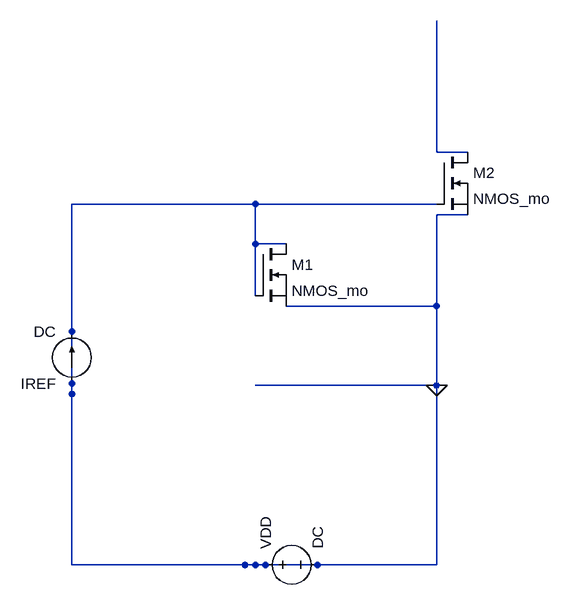
[diagram p0: schematic netlist7.asc]
netlist7.asc, the LTspice schematic file:
Version 4
SHEET 1 680 480
SYMBOL voltage 540 1095 R270
SYMATTR InstName VDD
SYMATTR Value DC
FLAG 819 819 0
SYMBOL current 258 816 R180
SYMATTR InstName IREF
SYMATTR Value DC
SYMBOL nmos 540 601 R0
SYMATTR InstName M1
SYMATTR Value NMOS_mo
SYMBOL nmos 819 460 R0
SYMATTR InstName M2
SYMATTR Value NMOS_mo
WIRE 258 1095 540 1095
WIRE 258 816 258 1095
WIRE 819 1095 524 1095
WIRE 819 1095 819 819
WIRE 258 540 258 832
WIRE 258 540 540 540
WIRE 540 819 819 819
WIRE 588 601 540 601
WIRE 540 601 540 540
WIRE 540 681 540 540
WIRE 588 697 819 697
WIRE 819 697 819 819
WIRE 867 460 819 460
WIRE 819 460 819 258
WIRE 819 540 540 540
WIRE 867 556 819 556
WIRE 819 556 819 819

The netlist it stands for:
* netlist7.asc
VDD 0 0 DC
IREF 0 0 DC
M1 0 0 0 0 NMOS_mo
M2 N001 0 0 0 NMOS_mo
.model NMOS NMOS
.model PMOS PMOS
.lib standard.mos
.backanno
.end